# Altium schematic sheet feed.SchDoc
size A4; SheetNumber: 1; SheetTotal: 1
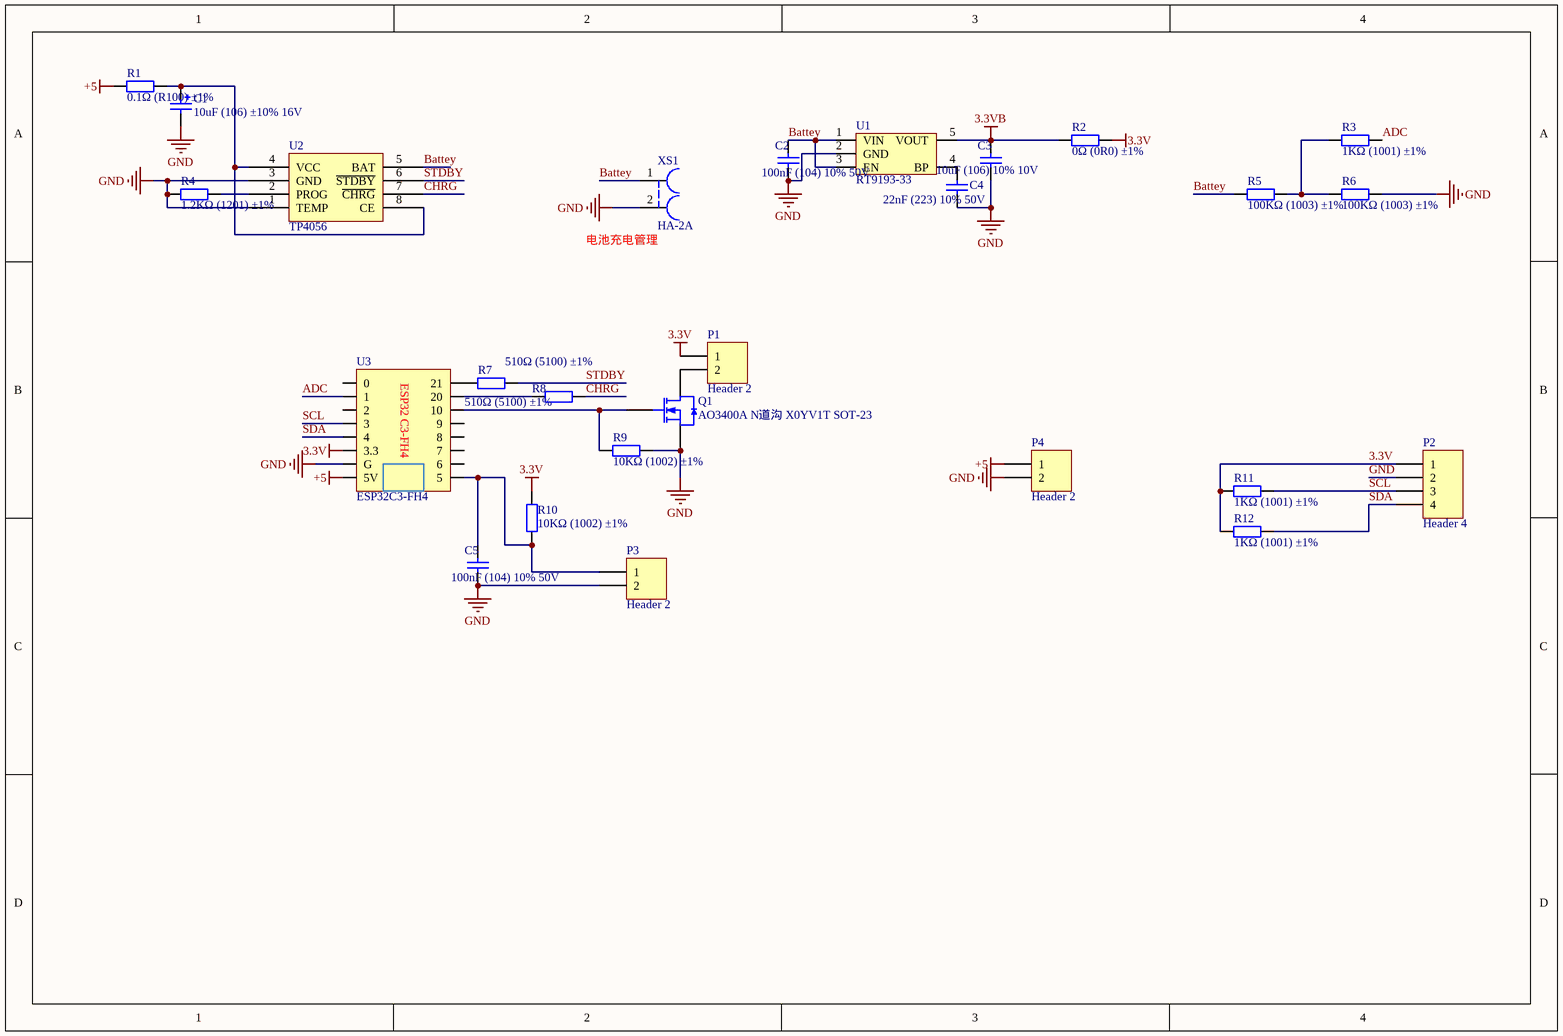
[diagram p0: feed.SchDoc]

## Parts
C1  10uF (106) ±10% 16V  [CASE-A_3216]
C2  100nF (104) 10% 50V  [0603_C]
C3  10uF (106) 10% 10V  [0603_C]
C4  22nF (223) 10% 50V  [0603_C]
C5  100nF (104) 10% 50V  [0603_C]
P1  Header 2  [HDR1X2]
P2  Header 4  [HDR1X4]
P3  Header 2  [HDR1X2]
P4  Header 2  [HDR1X2]
Q1  AO3400A N道沟 X0YV1T SOT-23  [SOT-23-3L]
R1  0.1Ω (R100) ±1%  [1206_R]
R2  0Ω (0R0) ±1%  [0402_R]
R3  1KΩ (1001) ±1%  [0603_R]
R4  1.2KΩ (1201) ±1%  [0603_R]
R5  100KΩ (1003) ±1%  [0603_R]
R6  100KΩ (1003) ±1%  [0603_R]
R7  510Ω (5100) ±1%  [0603_R]
R8  510Ω (5100) ±1%  [0603_R]
R9  10KΩ (1002) ±1%  [0603_R]
R10  10KΩ (1002) ±1%  [0603_R]
R11  1KΩ (1001) ±1%  [0603_R]
R12  1KΩ (1001) ±1%  [0603_R]
U1  RT9193-33  [SOT-23-5]
U2  TP4056  [SOP-8_EP_150mil]
U3  ESP32C3-FH4  [ESP32C3-FH4]
XS1  HA-2A  [HA-2A]

## Nets
3.3V: P1.1 P2.1 R2.2 R10.2 R11.1 R12.1 U3.6(3.3)
3.3VB: C3.2 R2.1 U1.5(VOUT)
+5: P4.1 R1.1 U3.8(5V)
GND: C1.2 C2.1 C3.1 C4.2 C5.1 P2.2 P3.2 P4.2 Q1.2(S) R4.1 R6.2 R9.2 U1.2(GND) U2.1(TEMP) U2.3(GND) U3.7(G) XS1.2
ADC: R3.2 U3.2(1)
Battey: C2.2 R5.1 U1.1(VIN) U1.3(EN) U2.5(BAT) XS1.1
CHRG: R8.2 U2.7(~{CHRG})
SCL: P2.3 R11.2 U3.4(3)
SDA: P2.4 R12.2 U3.5(4)
STDBY: R7.2 U2.6(~{STDBY})
NetC1_1: C1.1 R1.2 U2.4(VCC) U2.8(CE)
NetC4_1: C4.1 U1.4(BP)
NetC5_2: C5.2 P3.1 R10.1 U3.9(5)
NetP1_2: P1.2 Q1.3(D)
NetQ1_1: Q1.1(G) R9.1 U3.14(10)
NetR3_1: R3.1 R5.2 R6.1
NetR4_2: R4.2 U2.2(PROG)
NetR7_1: R7.1 U3.16(21)
NetR8_1: R8.1 U3.15(20)

Not connected (* = marked no-connect by the designer): U3 1(0) 3(2) 10(6) 11(7) 12(8) 13(9)

## Notes on the sheet
- (near XS1) 电池充电管理
- (in symbol ESP32C3-FH4) ESP32 C3-FH4

## Library data of the parts
C1 = 3216 10uF (106) 10% 16V: 钽电容; ComponentLink1Description: 供应商链接; ComponentLink1URL: http://www.szlcsc.com/product/details_7643.html; Package: 3216; Supplier: LC; SuppliersPartNumber: C7171
C2 C5 = 0603 100nF (104) 10% 50V: 贴片电容; ComponentLink1Description: 供应商链接; ComponentLink1URL: http://www.szlcsc.com/product/details_15331.html; Package: 0603; Supplier: LC; SuppliersPartNumber: C14663
C3 = 0603 10uF (106) 10% 10V: 贴片电容; ComponentLink1Description: 供应商链接; ComponentLink1URL: http://www.szlcsc.com/product/details_20411.html; Package: 0603; Supplier: LC; SuppliersPartNumber: C19702
C4 = 0603 22nF (223) 10% 50V: 贴片电容; ComponentLink1Description: 供应商链接; ComponentLink1URL: http://www.szlcsc.com/product/details_21834.html; Package: 0603; Supplier: LC; SuppliersPartNumber: C21122
P1 P3 P4 = Header 2: Header, 2-Pin; LatestRevisionDate: 17-Jul-2002; LatestRevisionNote: Re-released for DXP Platform.; Publisher: Altium Limited
P2 = Header 4: Header, 4-Pin; LatestRevisionDate: 17-Jul-2002; LatestRevisionNote: Re-released for DXP Platform.; Publisher: Altium Limited
Q1 = AO3400A N道沟 X0YV1T SOT-23: MOS(场效应管); ComponentLink1Description: 供应商链接; ComponentLink1URL: http://www.szlcsc.com/product/details_21629.html; Package: SOT-23; Supplier: LC; SuppliersPartNumber: C20917
R1 = 1206 0.1Ω (R100) 1%: 贴片电阻; ComponentLink1Description: 供应商链接; ComponentLink1URL: http://www.szlcsc.com/product/details_26077.html; Package: 1206; Supplier: LC; SuppliersPartNumber: C25334
R2 = 0402 0Ω (0R0) 1%: 贴片电阻; ComponentLink1Description: 供应商链接; ComponentLink1URL: http://www.szlcsc.com/product/details_17853.html; Package: 0402; Supplier: LC; SuppliersPartNumber: C17168
R3 R11 R12 = 0603 1KΩ (1001) 1%: 贴片电阻; ComponentLink1Description: 供应商链接; ComponentLink1URL: http://www.szlcsc.com/product/details_21904.html; Package: 0603; Supplier: LC; SuppliersPartNumber: C21190
R4 = 0603 1.2KΩ (1201) 1%: 贴片电阻; ComponentLink1Description: 供应商链接; ComponentLink1URL: http://www.szlcsc.com/product/details_23492.html; Package: 0603; Supplier: LC; SuppliersPartNumber: C22765
R5 R6 = 0603 100KΩ (1003) 1%: 贴片电阻; ComponentLink1Description: 供应商链接; ComponentLink1URL: http://www.szlcsc.com/product/details_26546.html; Package: 0603; Supplier: LC; SuppliersPartNumber: C25803
R7 R8 = 0603 510Ω (5100) 1%: 贴片电阻; ComponentLink1Description: 供应商链接; ComponentLink1URL: http://www.szlcsc.com/product/details_23920.html; Package: 0603; Supplier: LC; SuppliersPartNumber: C23193
R9 R10 = 0603 10KΩ (1002) 1%: 贴片电阻; ComponentLink1Description: 供应商链接; ComponentLink1URL: http://www.szlcsc.com/product/details_26547.html; Package: 0603; Supplier: LC; SuppliersPartNumber: C25804
U1 = RT9193-33: 3.3V超低压差LDO
U2 = TP4056_[C16581]: 电池电源管理; ComponentLink1Description: 供应商链接; ComponentLink1URL: http://www.szlcsc.com/product/details_17264.html; Package: SOP-8_EP_150mil; Supplier: LC; SuppliersPartNumber: C16581
U3 = ESP32C3-FH4: ESP32C3-FH4 内置4Mflash supermini核心板
XS1 = HA-2A: HA-2A 白色